# Altium schematic sheet PowerSupply.SchDoc
size OrCAD A
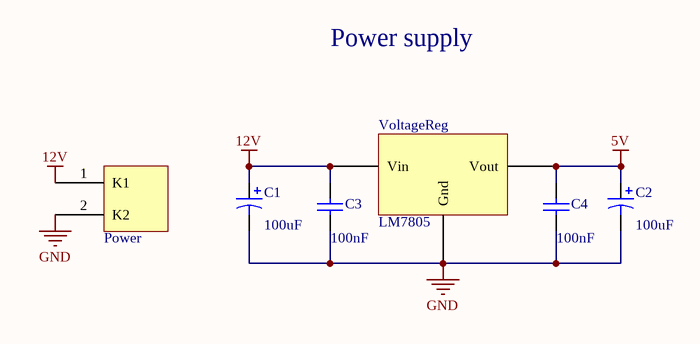
[diagram p0: PowerSupply.SchDoc]

## Parts
C1  value 100uF  [Electrolytic_Capacitor]  (hidden comment: Cap Pol1)
C2  value 100uF  [Electrolytic_Capacitor]  (hidden comment: Cap Pol1)
C3  value 100nF  [CeramicalCapacitor]  (hidden comment: Cap)
C4  value 100nF  [CeramicalCapacitor]  (hidden comment: Cap)
Power  Klema  [Klema]  (value not drawn)
VoltageReg  LM7805  [LM7805]

## Nets
5V: C2.1 C4.2 VoltageReg.3(Vout)
12V: C1.1 C3.2 Power.1(K1) VoltageReg.1(Vin)
GND: C1.2 C2.2 C3.1 C4.1 Power.2(K2) VoltageReg.2(Gnd)

## Notes on the sheet
- Power supply

## Library data of the parts
C1 C2 = Cap Pol1: Polarized Capacitor (Radial); Published: 8-Jun-2000; LatestRevisionDate: 17-Jul-2002; LatestRevisionNote: Re-released for DXP Platform.; PackageReference: RB7.6-15; Publisher: Altium Limited; PackageDescription: Polarized Capacitor (Radial); 2 Leads
C3 C4 = Cap: Capacitor; Published: 8-Jun-2000; LatestRevisionDate: 17-Jul-2002; LatestRevisionNote: Re-released for DXP Platform.; PackageReference: RAD-0.3; Publisher: Altium Limited; PackageDescription: Radial Cap, Thru-Hole; 2 Leads; 0.3 in Pin Spacing